# Altium schematic sheet Master.SchDoc
size A; SheetNumber: 1; SheetTotal: 1
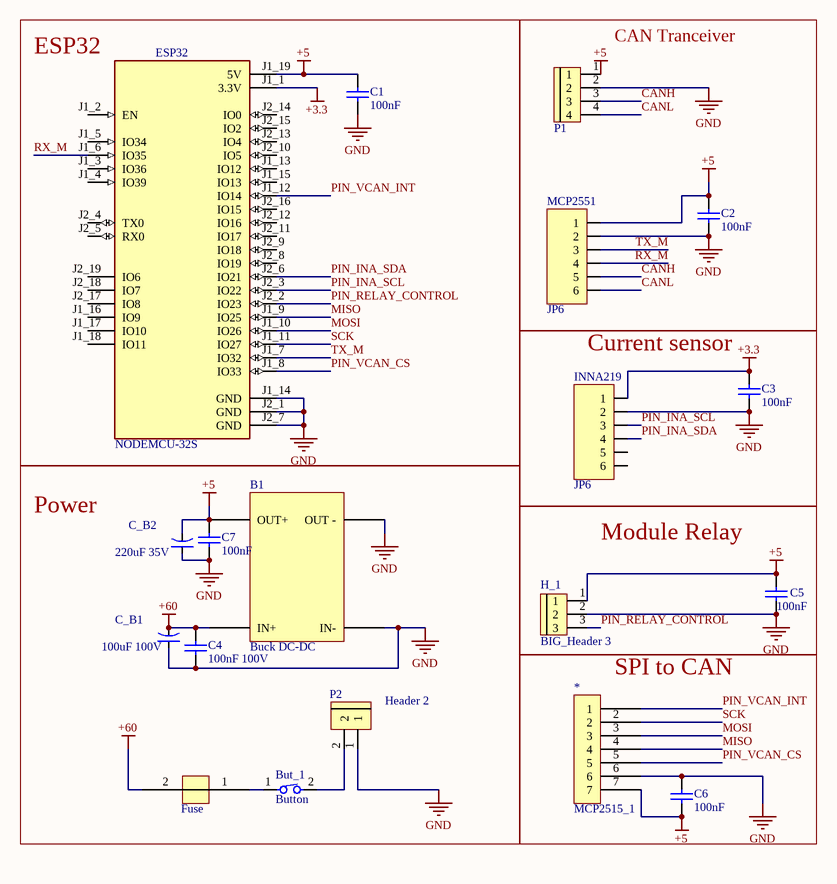
[diagram p0: Master.SchDoc]

## Parts
*  MCP2515_1  [MCP2515]
?  Fuse  [fuse]
B1  Buck DC-DC  [PCBComponent_1]
But_1  Button  [Button]
C1  value 100nF  [Tu-ceramic]  (hidden comment: Capacitor Ceramic)
C2  value 100nF  [Tu-ceramic]  (hidden comment: Capacitor Ceramic)
C3  value 100nF  [Tu-ceramic]  (hidden comment: Capacitor Ceramic)
C4  value 100nF 100V  [Tu-ceramic]  (hidden comment: Capacitor Ceramic)
C5  value 100nF  [Tu-ceramic]  (hidden comment: Capacitor Ceramic)
C6  value 100nF  [Tu-ceramic]  (hidden comment: Capacitor Ceramic)
C7  value 100nF  [Tu-ceramic]  (hidden comment: Capacitor Ceramic)
C_B1  100uF 100V  [CA-ALU-5W]
C_B2  220uF 35V  [CA-ALU-5W]
ESP32  NODEMCU-32S  [MODULE_NODEMCU-32S]
H_1  BIG_Header 3  [BIG_Header 3]
INNA219  JP6  [JP6-C1T]
MCP2551  JP6  [JP6-C1T]
P1  BIG Header 4  [BIG_Header 4]  (value not drawn)
P2  Header 2  [BIG_Header 2]

## Blocks framed on the sheet
ESP32: C1 ESP32
CAN Tranceiver: C2 MCP2551 P1
Current sensor: C3 INNA219
Power: ? B1 But_1 C4 C7 C_B1 C_B2 P2
Module Relay: C5 H_1
SPI to CAN: * C6

## Nets
+3.3: C3.1 ESP32.J1_1(3.3V) INNA219.1
+5: *.7 B1.4(OUT+) C1.2 C2.2 C5.1 C6.2 C7.2 C_B2.2 ESP32.J1_19(5V) H_1.1 MCP2551.1 P1.1
+60: ?.2 B1.2(IN+) C4.1 C_B1.2
GND: *.6 B1.1(IN-) B1.3(OUT_-) C1.1 C2.1 C3.2 C4.2 C5.2 C6.1 C7.1 C_B1.1 C_B2.1 ESP32.J1_14(GND) ESP32.J2_1(GND) ESP32.J2_7(GND) H_1.2 INNA219.2 MCP2551.2 P1.2 P2.1
CANH: MCP2551.5 P1.3
CANL: MCP2551.6 P1.4
MISO: *.4 ESP32.J1_9(IO25)
MOSI: *.3 ESP32.J1_10(IO26)
PIN_INA_SCL: ESP32.J2_3(IO22) INNA219.3
PIN_INA_SDA: ESP32.J2_6(IO21) INNA219.4
PIN_RELAY_CONTROL: ESP32.J2_2(IO23) H_1.3
PIN_VCAN_CS: *.5 ESP32.J1_8(IO33)
PIN_VCAN_INT: *.1 ESP32.J1_12(IO14)
RX_M: ESP32.J1_6(IO35) MCP2551.4
SCK: *.2 ESP32.J1_11(IO27)
TX_M: ESP32.J1_7(IO32) MCP2551.3
Net?_1: ?.1 But_1.1
NetBut_1_2: But_1.2 P2.2

Not connected (* = marked no-connect by the designer): ESP32 J1_2(EN) J1_3(IO36) J1_4(IO39) J1_5(IO34) J1_13(IO12) J1_15(IO13) J1_16(IO9) J1_17(IO10) J1_18(IO11) J2_4(TX0) J2_5(RX0) J2_8(IO19) J2_9(IO18) J2_10(IO5) J2_11(IO17) J2_12(IO16) J2_13(IO4) J2_14(IO0) J2_15(IO2) J2_16(IO15) J2_17(IO8) J2_18(IO7) J2_19(IO6); INNA219 5 6

## Library data of the parts
* = MCP2515_*
? = Component_1
C1-C7 = CapDecop: Capacitor; Published: 8-Jun-2000; LatestRevisionDate: 17-Jul-2002; LatestRevisionNote: Re-released for DXP Platform.; PackageReference: RAD-0.3; Publisher: Altium Limited
C_B1 C_B2 = CN-ALU-DIP: Capacitor (Semiconductor SIM Model); Value: 104; LatestRevisionDate: 17-Jul-2002; LatestRevisionNote: Re-released for DXP Platform.; PackageReference: C1206; Publisher: Altium Limited
ESP32 = NODEMCU-32S: WIFI MODULE V1; MF: AI-Thinker; SnapEDA_Link: https://www.snapeda.com/parts/NODEMCU-32S/AI-Thinker/view-part/?ref=snap; Package: Package; Value: *; MP: NODEMCU-32S; Check_prices: https://www.snapeda.com/parts/NODEMCU-32S/AI-Thinker/view-part/?ref=eda
INNA219 MCP2551 = JP6: WR-PHD 2.54 mm Angled Socket Header; Manufacturer: W¨¹rth Elektronik eiSos GmbH; partNo: 613006143121; ComponentLink1 Description: Manufacturer; ComponentLink2 Description: Datasheet; NoPins: 06; Created Date: 29 March 2013; ComponentLink1URL: http://www.we-online.com; ComponentLink2URL: http://katalog.we-online.de/em/datasheet/6130xx143121.pdf; Created by: Karrer Zheng
P1 = BIG_Header 4
P2 = Header 2: Big Header 2